# Altium schematic sheet System.SchDoc
size A; SheetNumber: 1; SheetTotal: 12
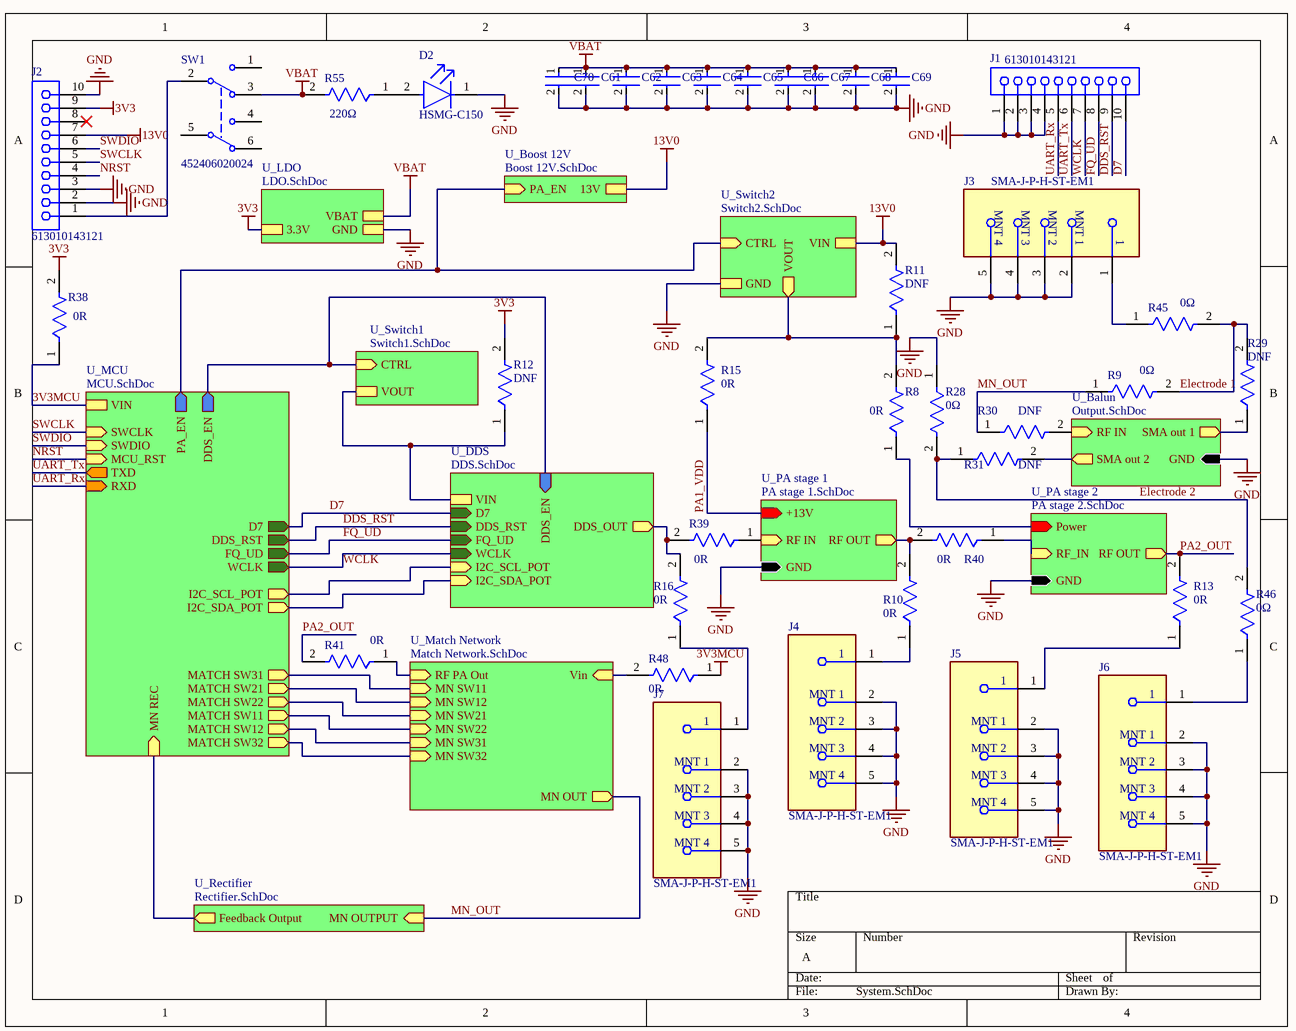
[diagram p0: System.SchDoc]

## Parts
C61  GRM21BR60J107ME15K  [FP-GRM21B-0_2-e0_2_0_7-IPC_B]  (value not drawn)
C62  GRM21BR60J107ME15K  [FP-GRM21B-0_2-e0_2_0_7-IPC_B]  (value not drawn)
C63  GRM21BR60J107ME15K  [FP-GRM21B-0_2-e0_2_0_7-IPC_B]  (value not drawn)
C64  GRM21BR60J107ME15K  [FP-GRM21B-0_2-e0_2_0_7-IPC_B]  (value not drawn)
C65  GRM21BR60J107ME15K  [FP-GRM21B-0_2-e0_2_0_7-IPC_B]  (value not drawn)
C66  GRM21BR60J107ME15K  [FP-GRM21B-0_2-e0_2_0_7-IPC_B]  (value not drawn)
C67  GRM21BR60J107ME15K  [FP-GRM21B-0_2-e0_2_0_7-IPC_B]  (value not drawn)
C68  GRM21BR60J107ME15K  [FP-GRM21B-0_2-e0_2_0_7-IPC_B]  (value not drawn)
C69  GRM21BR60J107ME15K  [FP-GRM21B-0_2-e0_2_0_7-IPC_B]  (value not drawn)
C70  GRM21BR60J107ME15K  [FP-GRM21B-0_2-e0_2_0_7-IPC_B]  (value not drawn)
D2  HSMG-C150  [FP-HSMG-C150-MFG]
J1  613010143121  [613010143121]
J2  613010143121  [613010143121]
J3  SMA-J-P-H-ST-EM1  [FP-SMA-J-P-H-ST-EM1-MFG]
J4  SMA-J-P-H-ST-EM1  [FP-SMA-J-P-H-ST-EM1-MFG]
J5  SMA-J-P-H-ST-EM1  [FP-SMA-J-P-H-ST-EM1-MFG]
J6  SMA-J-P-H-ST-EM1  [FP-SMA-J-P-H-ST-EM1-MFG]
J7  SMA-J-P-H-ST-EM1  [FP-SMA-J-P-H-ST-EM1-MFG]
R8  Resistance: 0R  [FP-RMCF0603-IPC_B]  (hidden comment: RMCF0603ZG0R00)
R9  Resistance: 0Ω  [FP-RMCF0603-IPC_B]  (hidden comment: RMCF0603ZG0R00)
R10  Resistance: 0R  [FP-RMCF0603-IPC_B]  (hidden comment: RMCF0603ZG0R00)
R11  DNF  [FP-RMCF0603-IPC_B]
R12  DNF  [FP-RMCF0603-IPC_B]
R13  Resistance: 0R  [FP-RMCF0603-IPC_B]  (hidden comment: RMCF0603ZG0R00)
R15  Resistance: 0R  [FP-RMCF0603-IPC_B]  (hidden comment: RMCF0603ZG0R00)
R16  Resistance: 0R  [FP-RMCF0603-IPC_B]  (hidden comment: RMCF0603ZG0R00)
R28  Resistance: 0Ω  [FP-RMCF0603-IPC_B]  (hidden comment: RMCF0603ZG0R00)
R29  DNF  [FP-RMCF0603-IPC_B]
R30  DNF  [FP-RMCF0603-IPC_B]
R31  DNF  [FP-RMCF0603-IPC_B]
R38  Resistance: 0R  [FP-RMCF0603-IPC_B]  (hidden comment: DNF)
R39  Resistance: 0R  [FP-RMCF0603-IPC_B]  (hidden comment: DNF)
R40  Resistance: 0R  [FP-RMCF0603-IPC_B]  (hidden comment: DNF)
R41  Resistance: 0R  [FP-RMCF0603-IPC_B]  (hidden comment: DNF)
R45  Resistance: 0Ω  [FP-RMCF0603-IPC_B]  (hidden comment: RMCF0603ZG0R00)
R46  Resistance: 0Ω  [FP-RMCF0603-IPC_B]  (hidden comment: RMCF0603ZG0R00)
R48  Resistance: 0R  [FP-RMCF0603-IPC_B]  (hidden comment: DNF)
R55  Resistance: 220Ω  [FP-CRCW0603-HPe3-IPC_A]  (hidden comment: CRCW0603220RFKEAHP)
SW1  452406020024  [452406020024]

## Sub-sheets
U_Balun = Output.SchDoc: RF IN (in), SMA out 1 (out), SMA out 2 (out), GND (in)
U_Boost 12V = Boost 12V.SchDoc: PA_EN (in), 13V
U_DDS = DDS.SchDoc: DDS_OUT (out), D7 (in), DDS_RST (in), FQ_UD (in), WCLK (in), I2C_SCL_POT (in), I2C_SDA_POT (in), DDS_EN (in), VIN
U_LDO = LDO.SchDoc: 3.3V, VBAT, GND
U_Match Network = Match Network.SchDoc: RF PA Out (in), MN SW11 (in), MN SW12 (in), MN SW21 (in), MN OUT (out), Vin (in), MN SW22 (in), MN SW31 (in), MN SW32 (in)
U_MCU = MCU.SchDoc: SWCLK (in), SWDIO (in), MCU_RST (in), TXD (out), D7 (out), DDS_RST (out), FQ_UD (out), WCLK (out), PA_EN (out), DDS_EN (out), RXD (in), I2C_SCL_POT (out), I2C_SDA_POT (out), MN REC (in), VIN, MATCH SW31 (out), MATCH SW21 (out), MATCH SW22 (out), MATCH SW11 (out), MATCH SW12 (out), MATCH SW32 (out)
U_PA stage 1 = PA stage 1.SchDoc: RF IN (in), RF OUT (out), GND (in), +13V (in)
U_PA stage 2 = PA stage 2.SchDoc: GND (in), Power (in), RF_IN (in), RF OUT (out)
U_Rectifier = Rectifier.SchDoc: MN OUTPUT (in), Feedback Output (out)
U_Switch1 = Switch1.SchDoc: CTRL (in), VOUT
U_Switch2 = Switch2.SchDoc: CTRL (in), VOUT (out), VIN, GND

## Nets
3V3: J2.9 R12.2 R38.2 ; sheet U_LDO/3.3V
3V3MCU: R38.1 R48.1 ; sheet U_MCU/VIN
13V0: J2.7 R11.2 ; sheet U_Boost 12V/13V, sheet U_Switch2/VIN
GND: C61.2 C62.2 C63.2 C64.2 C65.2 C66.2 C67.2 C68.2 C69.2 C70.2 D2.1(C) J1.1 J1.2 J1.3 J1.4 J2.2 J2.3 J2.10 J3.2(MNT_1) J3.3(MNT_2) J3.4(MNT_3) J3.5(MNT_4) J4.2(MNT_1) J4.3(MNT_2) J4.4(MNT_3) J4.5(MNT_4) J5.2(MNT_1) J5.3(MNT_2) J5.4(MNT_3) J5.5(MNT_4) J6.2(MNT_1) J6.3(MNT_2) J6.4(MNT_3) J6.5(MNT_4) J7.2(MNT_1) J7.3(MNT_2) J7.4(MNT_3) J7.5(MNT_4) R28.1 ; sheet U_PA stage 1/GND, sheet U_PA stage 2/GND, sheet U_LDO/GND, sheet U_Switch2/GND, sheet U_Balun/GND
VBAT: C61.1 C62.1 C63.1 C64.1 C65.1 C66.1 C67.1 C68.1 C69.1 C70.1 R55.2 SW1.3 ; sheet U_LDO/VBAT
D7: J1.10 ; sheet U_MCU/D7, sheet U_DDS/D7
DDS_RST: J1.9 ; sheet U_MCU/DDS_RST, sheet U_DDS/DDS_RST
Electrode 1: R9.2 R29.2 R45.2
Electrode 2: R28.2 R31.1 R46.2
FQ_UD: J1.8 ; sheet U_MCU/FQ_UD, sheet U_DDS/FQ_UD
MN_OUT: R9.1 R30.1 ; sheet U_Rectifier/MN OUTPUT, sheet U_Match Network/MN OUT
NRST: J2.4 ; sheet U_MCU/MCU_RST
PA1_VDD: R15.1 ; sheet U_PA stage 1/+13V
PA2_OUT: R13.2 R41.2 ; sheet U_PA stage 2/RF OUT
SWCLK: J2.5 ; sheet U_MCU/SWCLK
SWDIO: J2.6 ; sheet U_MCU/SWDIO
UART_Rx: J1.5 ; sheet U_MCU/RXD
UART_Tx: J1.6 ; sheet U_MCU/TXD
WCLK: J1.7 ; sheet U_MCU/WCLK, sheet U_DDS/WCLK
NetD2_2: D2.2(A) R55.1
NetJ2_1: J2.1 SW1.2(COM)
NetJ3_1: J3.1 R45.1
NetJ4_1: J4.1 R10.1
NetJ5_1: J5.1 R13.1
NetJ6_1: J6.1 R46.1
NetJ7_1: J7.1 R16.1
NetR8_1: R8.1 ; sheet U_PA stage 2/Power
NetR8_2: R8.2 R11.1 R15.2 ; sheet U_Switch2/VOUT
NetR10_2: R10.2 R40.2 ; sheet U_PA stage 1/RF OUT
NetR12_1: R12.1 ; sheet U_DDS/VIN, sheet U_Switch1/VOUT
NetR16_2: R16.2 R39.2 ; sheet U_DDS/DDS_OUT
NetR29_1: R29.1 ; sheet U_Balun/SMA out 1
NetR30_2: R30.2 ; sheet U_Balun/RF IN
NetR31_2: R31.2 ; sheet U_Balun/SMA out 2
NetR39_1: R39.1 ; sheet U_PA stage 1/RF IN
NetR40_1: R40.1 ; sheet U_PA stage 2/RF_IN
NetR41_1: R41.1 ; sheet U_Match Network/RF PA Out
NetR48_2: R48.2 ; sheet U_Match Network/Vin
(unnamed): sheet U_MCU/PA_EN, sheet U_Boost 12V/PA_EN, sheet U_Switch2/CTRL
(unnamed): sheet U_MCU/DDS_EN, sheet U_DDS/DDS_EN, sheet U_Switch1/CTRL
(unnamed): sheet U_MCU/I2C_SCL_POT, sheet U_DDS/I2C_SCL_POT
(unnamed): sheet U_MCU/I2C_SDA_POT, sheet U_DDS/I2C_SDA_POT
(unnamed): sheet U_MCU/MN REC, sheet U_Rectifier/Feedback Output
(unnamed): sheet U_MCU/MATCH SW31, sheet U_Match Network/MN SW11
(unnamed): sheet U_MCU/MATCH SW21, sheet U_Match Network/MN SW12
(unnamed): sheet U_MCU/MATCH SW22, sheet U_Match Network/MN SW21
(unnamed): sheet U_MCU/MATCH SW11, sheet U_Match Network/MN SW22
(unnamed): sheet U_MCU/MATCH SW12, sheet U_Match Network/MN SW31
(unnamed): sheet U_MCU/MATCH SW32, sheet U_Match Network/MN SW32

Not connected (* = marked no-connect by the designer): J2 8*; SW1 1 4 5(COM) 6

## Library data of the parts
C61-C70 = CMP-06035-052658-1: Chip Multilayer Ceramic Capacitors for General Purpose, 0805, 100uF, X5R, 15%, 20%, 6.3V; Voltage Rating (DC): 6.3V; Lead Free: Lead Free; Length: 2mm; Tolerance: 20%; Width: 1.25mm; Capacitance: 100uF; Dielectric: X5R; Thickness: 1.25mm
D2 = CMP-2000-05061-2: LED GREEN DIFFUSED 1206 SMD; Manufacturer: Broadcom; Led Orientation: Top View; Max Junction Temp: +95°C; Peak Emmision Wavelength: 570nm; Viewing Angle: 170°; Wavelength: 572nm; Reverse Voltage: 5V; Luminous Intensity: 15mcd; Forward Voltage: 2.2V; Power Dissipation: 65mW; Forward Current: 20mA; ComponentLink2Description: Datasheet; Lead Free: Yes; Temperature Range Low: -40°C; Package: HSMG-C150; Digikey Description: LED GREEN DIFFUSED 1206 SMD; Mouser Description: LED Uni-Color Green 570nm 2-Pin Chip LED T/R; Manufacturer Part Number: HSMG-C150; Temperature Range High: +85°C; Device Class L1: Optoelectronics; Colour: Green; Category: Diode; Device Class L3: unset; RoHS: TRUE; Height: 1.2mm; ComponentLink2URL: https://docs.broadcom.com/docs/AV02-0551EN; Device Class L2: LEDs; Automotive: No; Ipc Land Pattern Name: DIOCP320160X55; Octopart: https://octopart.com/hsmg-c150-broadcom-71131304; Temperature: -40°C to +85°C
J1 J2 = CMP-1502-01419-3: NexarPartId: 18818161; Operating Supply Voltage: 250V; Contact Resistance: 20mΩ; Gender: Female; Insulation Resistance: 1GΩ; Connector Type: Header, Socket; Insulation: Insulated; Current Rating: 3A; Number of Positions: 10; Pitch: 2.54mm; Number of Rows: 1; Number of Pins: 10; Voltage Rating: 250V; Length: 25.9mm; Contact Gender: Female; RoHS: Compliant; Contact Plating: Gold; Height: 8.5mm; Min Operating Temperature: -40°C; Contact Material: Copper; Number of Contacts: 10; REACH SVHC: Unknown; Mount: Through Hole; Lead Pitch: 2.54mm; Width: 25.9mm; Max Operating Temperature: 125°C; Flammability Rating: UL94 V-0; Termination: Through Hole; Color: Black; Housing Material: PBT
J3-J7 = CMP-02754-000006-1: CONN SMA JACK STR 50OHM EDGE MNT; Dielectric Material: PTFE; Center Contact Plating: Gold; Max Frequency: 6GHz; Body Material: Brass; Voltage Rating: 335V; Impedance: 50R; Package Quantity: 1; Case/Package: SMA; Max Operating Temperature: 125°C; Fastening Type: Threaded; Orientation: Straight; Depth: 13.33mm; RoHS Compliant: Yes; Length: 6.35mm; Insulation Material: Polytetrafluoroethylene; Termination: Solder; Min Operating Temperature: -65°C; Housing Color: Gold; Contact Plating: Gold; Contact Material: Copper; Connector Type: SMA; Mount: Edge; Series: SMA; Packaging: Tray; Body Plating: Gold; Radiation Hardening: No
R8-R10 R13 R15 R16 R28-R31 R38-R41 R45 R46 R48 = CMP-26527-006412-1: 0Ω ±0 0.1W 0603 Thick Film Chip Resistor AEC-Q200 compliant; Max Power Dissipation: 100mW; Width: 0.031inch; RoHS Compliant: Yes; Number of Terminations: 2; Case/Package: 0603; Contact Plating: Tin; Height: 0.022inch; Resistor Type: Thick Film; Mount: Surface Mount; Length: 0.061inch; Features: Automotive AEC-Q200; Series: RMCF; Max Operating Temperature: 155°C; Radiation Hardening: No; Min Operating Temperature: -55°C; Packaging: Tape and Reel
  R29-R31: Resistance: 0Ω
R11 R12 = CMP-26527-006412-1: 0Ω ±0 0.1W 0603 Thick Film Chip Resistor AEC-Q200 compliant; Max Power Dissipation: 100mW; Resistance: 0R; Width: 0.031inch; RoHS Compliant: Yes; Number of Terminations: 2; Case/Package: 0603; Contact Plating: Tin; Height: 0.022inch; Resistor Type: Thick Film; Mount: Surface Mount; Length: 0.061inch; Features: Automotive AEC-Q200; Series: RMCF; Max Operating Temperature: 155°C; Radiation Hardening: No; Min Operating Temperature: -55°C; Packaging: Tape and Reel
R55 = CMP-02407-003593-1: RES Thick Film, 220Ω, 1%, 0.33W, 100ppm/°C, 0603; Max Power Dissipation: 250mW; Voltage Rating (DC): 75V; Radiation Hardening: No; Contact Plating: Tin; Length: 1.6mm; Depth: 0.85mm; Composition: Thick Film; Lead Free: Lead Free; Mount: Surface Mount; Package Quantity: 5000; Height: 0.45mm; Termination: SMD/SMT; Weight: 7.1E-05oz; Military Standard: Not; Number of Terminations: 2; Case Code (Metric): 1608; Max Operating Temperature: 155°C; Power Rating: 250mW; Tolerance: 1%; Temperature Coefficient: 100ppm/°C; Features: Automotive AEC-Q200; Case Code (Imperial): 0603; Width: 0.033inch; Min Operating Temperature: -55°C; Case/Package: 0603; Voltage Rating: 75V; Packaging: Tape and Reel
SW1 = CMP-03913-146831046-1: Ws-slsv_smt Mini Slide Switch Sa